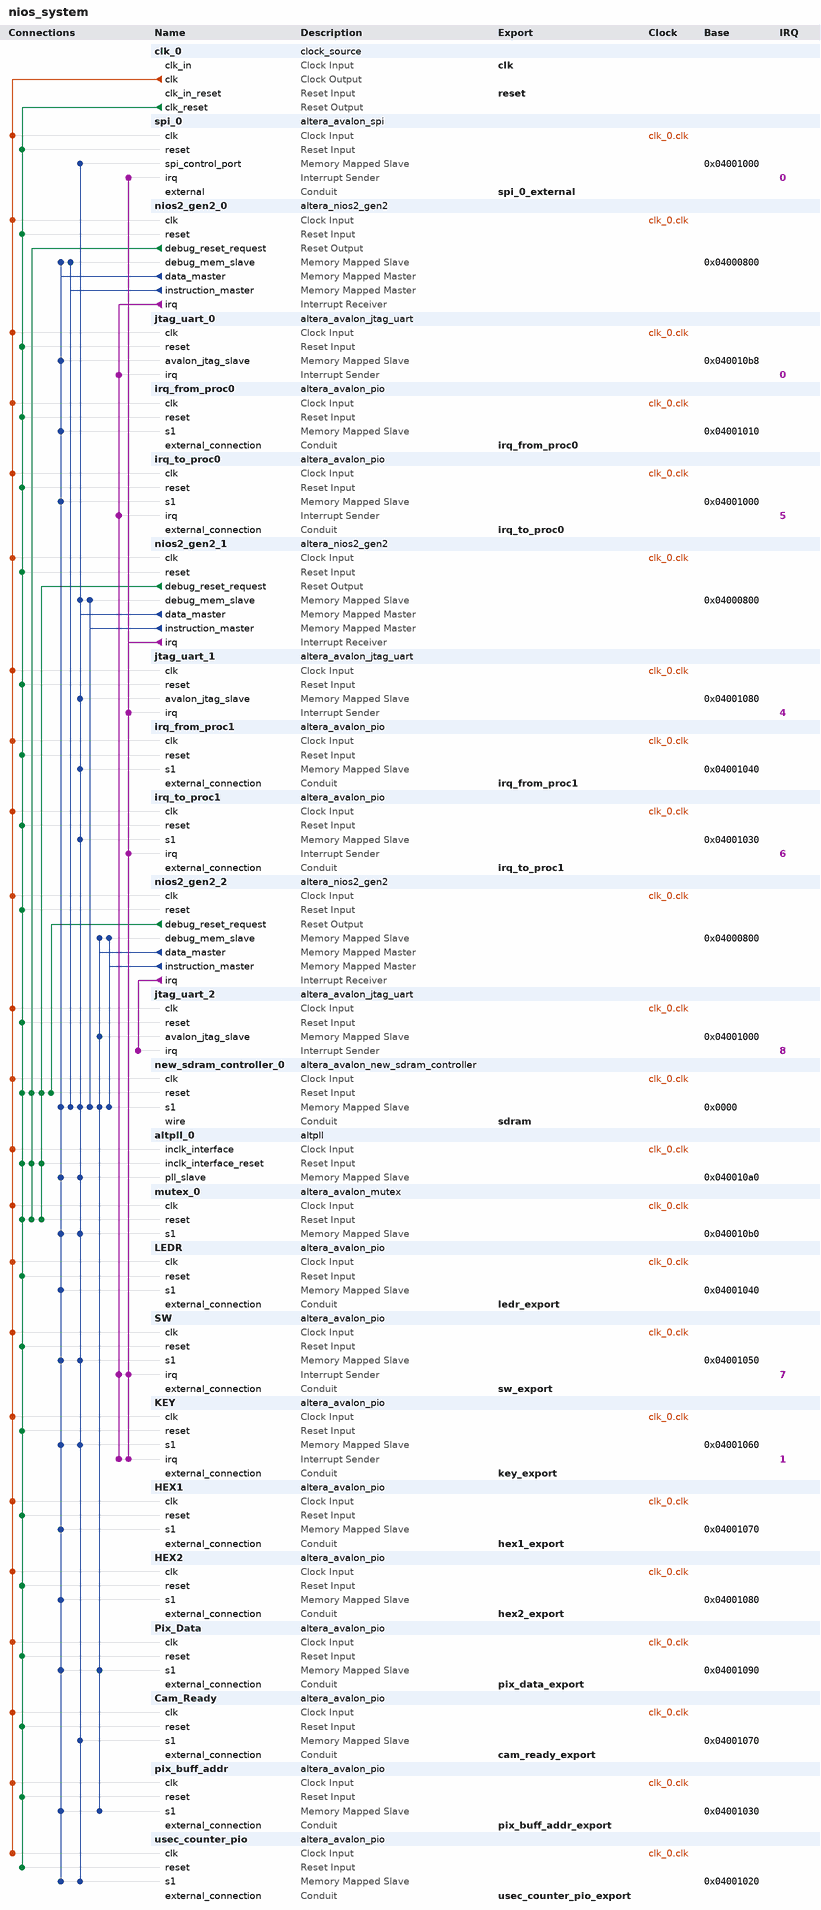
[diagram p0: system contents]
# Platform Designer (Qsys) system nios_system, MAX 10 10M50DAF484C7G
# Parameters at their usual value, and those the tool derives, are not listed.
package require -exact qsys 18.1
create_system nios_system
set_project_property DEVICE_FAMILY {MAX 10}
set_project_property DEVICE 10M50DAF484C7G

add_instance clk_0 clock_source 18.1
set_instance_parameter_value clk_0 clockFrequency 50000000

add_instance spi_0 altera_avalon_spi 18.1
set_instance_parameter_value spi_0 clockPhase 1
set_instance_parameter_value spi_0 clockPolarity 1
set_instance_parameter_value spi_0 dataWidth 8
set_instance_parameter_value spi_0 masterSPI true
set_instance_parameter_value spi_0 numberOfSlaves 2
set_instance_parameter_value spi_0 targetClockRate 5000000

add_instance nios2_gen2_0 altera_nios2_gen2 18.1
set_instance_parameter_value nios2_gen2_0 dcache_size 2048
set_instance_parameter_value nios2_gen2_0 exceptionSlave new_sdram_controller_0.s1
set_instance_parameter_value nios2_gen2_0 icache_size 4096
set_instance_parameter_value nios2_gen2_0 impl Fast
set_instance_parameter_value nios2_gen2_0 resetSlave new_sdram_controller_0.s1

add_instance jtag_uart_0 altera_avalon_jtag_uart 18.1
set_instance_parameter_value jtag_uart_0 simInteractiveOptions NO_INTERACTIVE_WINDOWS

add_instance irq_from_proc0 altera_avalon_pio 18.1
set_instance_parameter_value irq_from_proc0 direction Output
set_instance_parameter_value irq_from_proc0 width 1

add_instance irq_to_proc0 altera_avalon_pio 18.1
set_instance_parameter_value irq_to_proc0 direction Input
set_instance_parameter_value irq_to_proc0 generateIRQ true
set_instance_parameter_value irq_to_proc0 width 1

add_instance nios2_gen2_1 altera_nios2_gen2 18.1
set_instance_parameter_value nios2_gen2_1 cpuID 1
set_instance_parameter_value nios2_gen2_1 dcache_size 2048
set_instance_parameter_value nios2_gen2_1 exceptionOffset 33554464
set_instance_parameter_value nios2_gen2_1 exceptionSlave new_sdram_controller_0.s1
set_instance_parameter_value nios2_gen2_1 icache_size 4096
set_instance_parameter_value nios2_gen2_1 impl Fast
set_instance_parameter_value nios2_gen2_1 resetOffset 33554432
set_instance_parameter_value nios2_gen2_1 resetSlave new_sdram_controller_0.s1

add_instance jtag_uart_1 altera_avalon_jtag_uart 18.1
set_instance_parameter_value jtag_uart_1 simInteractiveOptions NO_INTERACTIVE_WINDOWS

add_instance irq_from_proc1 altera_avalon_pio 18.1
set_instance_parameter_value irq_from_proc1 direction Output
set_instance_parameter_value irq_from_proc1 width 1

add_instance irq_to_proc1 altera_avalon_pio 18.1
set_instance_parameter_value irq_to_proc1 direction Input
set_instance_parameter_value irq_to_proc1 generateIRQ true
set_instance_parameter_value irq_to_proc1 width 1

add_instance nios2_gen2_2 altera_nios2_gen2 18.1
set_instance_parameter_value nios2_gen2_2 cpuID 2
set_instance_parameter_value nios2_gen2_2 dcache_size 2048
set_instance_parameter_value nios2_gen2_2 exceptionOffset 8000064
set_instance_parameter_value nios2_gen2_2 exceptionSlave new_sdram_controller_0.s1
set_instance_parameter_value nios2_gen2_2 icache_size 4096
set_instance_parameter_value nios2_gen2_2 impl Fast
set_instance_parameter_value nios2_gen2_2 resetOffset 8000032
set_instance_parameter_value nios2_gen2_2 resetSlave new_sdram_controller_0.s1

add_instance jtag_uart_2 altera_avalon_jtag_uart 18.1
set_instance_parameter_value jtag_uart_2 simInteractiveOptions NO_INTERACTIVE_WINDOWS

add_instance new_sdram_controller_0 altera_avalon_new_sdram_controller 18.1
set_instance_parameter_value new_sdram_controller_0 TAC 5.5
set_instance_parameter_value new_sdram_controller_0 TRCD 20.0
set_instance_parameter_value new_sdram_controller_0 TRP 20.0
set_instance_parameter_value new_sdram_controller_0 casLatency 3
set_instance_parameter_value new_sdram_controller_0 columnWidth 10
set_instance_parameter_value new_sdram_controller_0 dataWidth 16
set_instance_parameter_value new_sdram_controller_0 generateSimulationModel false
set_instance_parameter_value new_sdram_controller_0 model single_Micron_MT48LC4M32B2_7_chip
set_instance_parameter_value new_sdram_controller_0 numberOfBanks 4
set_instance_parameter_value new_sdram_controller_0 numberOfChipSelects 1
set_instance_parameter_value new_sdram_controller_0 powerUpDelay 100.0
set_instance_parameter_value new_sdram_controller_0 refreshPeriod 15.625
set_instance_parameter_value new_sdram_controller_0 rowWidth 13

add_instance altpll_0 altpll 18.1
set_instance_parameter_value altpll_0 CLK0_DIVIDE_BY 1
set_instance_parameter_value altpll_0 CLK0_MULTIPLY_BY 1
set_instance_parameter_value altpll_0 CLK0_PHASE_SHIFT -3000
set_instance_parameter_value altpll_0 INCLK0_INPUT_FREQUENCY 20000
set_instance_parameter_value altpll_0 PORT_ARESET PORT_UNUSED
set_instance_parameter_value altpll_0 PORT_LOCKED PORT_UNUSED
set_instance_parameter_value altpll_0 PORT_clk1 PORT_UNUSED
set_instance_parameter_value altpll_0 PORT_clk2 PORT_UNUSED
set_instance_parameter_value altpll_0 PORT_clk3 PORT_UNUSED

add_instance mutex_0 altera_avalon_mutex 18.1

add_instance LEDR altera_avalon_pio 18.1
set_instance_parameter_value LEDR direction Output
set_instance_parameter_value LEDR width 10

add_instance SW altera_avalon_pio 18.1
set_instance_parameter_value SW captureEdge true
set_instance_parameter_value SW direction Input
set_instance_parameter_value SW generateIRQ true
set_instance_parameter_value SW irqType EDGE
set_instance_parameter_value SW width 10

add_instance KEY altera_avalon_pio 18.1
set_instance_parameter_value KEY captureEdge true
set_instance_parameter_value KEY direction Input
set_instance_parameter_value KEY generateIRQ true
set_instance_parameter_value KEY irqType EDGE
set_instance_parameter_value KEY width 2

add_instance HEX1 altera_avalon_pio 18.1
set_instance_parameter_value HEX1 direction Output
set_instance_parameter_value HEX1 width 24

add_instance HEX2 altera_avalon_pio 18.1
set_instance_parameter_value HEX2 direction Output
set_instance_parameter_value HEX2 width 24

add_instance Pix_Data altera_avalon_pio 18.1
set_instance_parameter_value Pix_Data direction Output
set_instance_parameter_value Pix_Data width 4

add_instance Cam_Ready altera_avalon_pio 18.1
set_instance_parameter_value Cam_Ready direction Input
set_instance_parameter_value Cam_Ready width 1

add_instance pix_buff_addr altera_avalon_pio 18.1
set_instance_parameter_value pix_buff_addr direction Output
set_instance_parameter_value pix_buff_addr width 17

add_instance usec_counter_pio altera_avalon_pio 18.1
set_instance_parameter_value usec_counter_pio direction Input
set_instance_parameter_value usec_counter_pio width 32

# connections
add_connection clk_0.clk altpll_0.inclk_interface clock
add_connection clk_0.clk Cam_Ready.clk clock
add_connection clk_0.clk HEX1.clk clock
add_connection clk_0.clk HEX2.clk clock
add_connection clk_0.clk irq_from_proc0.clk clock
add_connection clk_0.clk irq_from_proc1.clk clock
add_connection clk_0.clk irq_to_proc0.clk clock
add_connection clk_0.clk irq_to_proc1.clk clock
add_connection clk_0.clk jtag_uart_0.clk clock
add_connection clk_0.clk jtag_uart_1.clk clock
add_connection clk_0.clk jtag_uart_2.clk clock
add_connection clk_0.clk KEY.clk clock
add_connection clk_0.clk LEDR.clk clock
add_connection clk_0.clk mutex_0.clk clock
add_connection clk_0.clk new_sdram_controller_0.clk clock
add_connection clk_0.clk nios2_gen2_0.clk clock
add_connection clk_0.clk nios2_gen2_1.clk clock
add_connection clk_0.clk nios2_gen2_2.clk clock
add_connection clk_0.clk pix_buff_addr.clk clock
add_connection clk_0.clk Pix_Data.clk clock
add_connection clk_0.clk spi_0.clk clock
add_connection clk_0.clk SW.clk clock
add_connection clk_0.clk usec_counter_pio.clk clock
add_connection clk_0.clk_reset altpll_0.inclk_interface_reset reset
add_connection clk_0.clk_reset Cam_Ready.reset reset
add_connection clk_0.clk_reset HEX1.reset reset
add_connection clk_0.clk_reset HEX2.reset reset
add_connection clk_0.clk_reset irq_from_proc0.reset reset
add_connection clk_0.clk_reset irq_from_proc1.reset reset
add_connection clk_0.clk_reset irq_to_proc0.reset reset
add_connection clk_0.clk_reset irq_to_proc1.reset reset
add_connection clk_0.clk_reset jtag_uart_0.reset reset
add_connection clk_0.clk_reset jtag_uart_1.reset reset
add_connection clk_0.clk_reset jtag_uart_2.reset reset
add_connection clk_0.clk_reset KEY.reset reset
add_connection clk_0.clk_reset LEDR.reset reset
add_connection clk_0.clk_reset mutex_0.reset reset
add_connection clk_0.clk_reset new_sdram_controller_0.reset reset
add_connection clk_0.clk_reset nios2_gen2_0.reset reset
add_connection clk_0.clk_reset nios2_gen2_1.reset reset
add_connection clk_0.clk_reset nios2_gen2_2.reset reset
add_connection clk_0.clk_reset pix_buff_addr.reset reset
add_connection clk_0.clk_reset Pix_Data.reset reset
add_connection clk_0.clk_reset spi_0.reset reset
add_connection clk_0.clk_reset SW.reset reset
add_connection clk_0.clk_reset usec_counter_pio.reset reset
add_connection nios2_gen2_0.debug_reset_request altpll_0.inclk_interface_reset reset
add_connection nios2_gen2_0.debug_reset_request mutex_0.reset reset
add_connection nios2_gen2_0.debug_reset_request new_sdram_controller_0.reset reset
add_connection nios2_gen2_1.debug_reset_request altpll_0.inclk_interface_reset reset
add_connection nios2_gen2_1.debug_reset_request mutex_0.reset reset
add_connection nios2_gen2_1.debug_reset_request new_sdram_controller_0.reset reset
add_connection nios2_gen2_2.debug_reset_request new_sdram_controller_0.reset reset
add_connection nios2_gen2_0.data_master altpll_0.pll_slave avalon
set_connection_parameter_value nios2_gen2_0.data_master/altpll_0.pll_slave baseAddress 0x040010a0
add_connection nios2_gen2_0.data_master HEX1.s1 avalon
set_connection_parameter_value nios2_gen2_0.data_master/HEX1.s1 baseAddress 0x04001070
add_connection nios2_gen2_0.data_master HEX2.s1 avalon
set_connection_parameter_value nios2_gen2_0.data_master/HEX2.s1 baseAddress 0x04001080
add_connection nios2_gen2_0.data_master irq_from_proc0.s1 avalon
set_connection_parameter_value nios2_gen2_0.data_master/irq_from_proc0.s1 baseAddress 0x04001010
add_connection nios2_gen2_0.data_master irq_to_proc0.s1 avalon
set_connection_parameter_value nios2_gen2_0.data_master/irq_to_proc0.s1 baseAddress 0x04001000
add_connection nios2_gen2_0.data_master jtag_uart_0.avalon_jtag_slave avalon
set_connection_parameter_value nios2_gen2_0.data_master/jtag_uart_0.avalon_jtag_slave baseAddress 0x040010b8
add_connection nios2_gen2_0.data_master KEY.s1 avalon
set_connection_parameter_value nios2_gen2_0.data_master/KEY.s1 baseAddress 0x04001060
add_connection nios2_gen2_0.data_master LEDR.s1 avalon
set_connection_parameter_value nios2_gen2_0.data_master/LEDR.s1 baseAddress 0x04001040
add_connection nios2_gen2_0.data_master mutex_0.s1 avalon
set_connection_parameter_value nios2_gen2_0.data_master/mutex_0.s1 baseAddress 0x040010b0
add_connection nios2_gen2_0.data_master new_sdram_controller_0.s1 avalon
set_connection_parameter_value nios2_gen2_0.data_master/new_sdram_controller_0.s1 baseAddress 0x0000
add_connection nios2_gen2_0.data_master nios2_gen2_0.debug_mem_slave avalon
set_connection_parameter_value nios2_gen2_0.data_master/nios2_gen2_0.debug_mem_slave baseAddress 0x04000800
add_connection nios2_gen2_0.data_master pix_buff_addr.s1 avalon
set_connection_parameter_value nios2_gen2_0.data_master/pix_buff_addr.s1 baseAddress 0x04001030
add_connection nios2_gen2_0.data_master Pix_Data.s1 avalon
set_connection_parameter_value nios2_gen2_0.data_master/Pix_Data.s1 baseAddress 0x04001090
add_connection nios2_gen2_0.data_master SW.s1 avalon
set_connection_parameter_value nios2_gen2_0.data_master/SW.s1 baseAddress 0x04001050
add_connection nios2_gen2_0.data_master usec_counter_pio.s1 avalon
set_connection_parameter_value nios2_gen2_0.data_master/usec_counter_pio.s1 baseAddress 0x04001020
add_connection nios2_gen2_0.instruction_master new_sdram_controller_0.s1 avalon
set_connection_parameter_value nios2_gen2_0.instruction_master/new_sdram_controller_0.s1 baseAddress 0x0000
add_connection nios2_gen2_0.instruction_master nios2_gen2_0.debug_mem_slave avalon
set_connection_parameter_value nios2_gen2_0.instruction_master/nios2_gen2_0.debug_mem_slave baseAddress 0x04000800
add_connection nios2_gen2_1.data_master altpll_0.pll_slave avalon
set_connection_parameter_value nios2_gen2_1.data_master/altpll_0.pll_slave baseAddress 0x040010a0
add_connection nios2_gen2_1.data_master Cam_Ready.s1 avalon
set_connection_parameter_value nios2_gen2_1.data_master/Cam_Ready.s1 baseAddress 0x04001070
add_connection nios2_gen2_1.data_master irq_from_proc1.s1 avalon
set_connection_parameter_value nios2_gen2_1.data_master/irq_from_proc1.s1 baseAddress 0x04001040
add_connection nios2_gen2_1.data_master irq_to_proc1.s1 avalon
set_connection_parameter_value nios2_gen2_1.data_master/irq_to_proc1.s1 baseAddress 0x04001030
add_connection nios2_gen2_1.data_master jtag_uart_1.avalon_jtag_slave avalon
set_connection_parameter_value nios2_gen2_1.data_master/jtag_uart_1.avalon_jtag_slave baseAddress 0x04001080
add_connection nios2_gen2_1.data_master KEY.s1 avalon
set_connection_parameter_value nios2_gen2_1.data_master/KEY.s1 baseAddress 0x04001060
add_connection nios2_gen2_1.data_master mutex_0.s1 avalon
set_connection_parameter_value nios2_gen2_1.data_master/mutex_0.s1 baseAddress 0x040010b0
add_connection nios2_gen2_1.data_master new_sdram_controller_0.s1 avalon
set_connection_parameter_value nios2_gen2_1.data_master/new_sdram_controller_0.s1 baseAddress 0x0000
add_connection nios2_gen2_1.data_master nios2_gen2_1.debug_mem_slave avalon
set_connection_parameter_value nios2_gen2_1.data_master/nios2_gen2_1.debug_mem_slave baseAddress 0x04000800
add_connection nios2_gen2_1.data_master spi_0.spi_control_port avalon
set_connection_parameter_value nios2_gen2_1.data_master/spi_0.spi_control_port baseAddress 0x04001000
add_connection nios2_gen2_1.data_master SW.s1 avalon
set_connection_parameter_value nios2_gen2_1.data_master/SW.s1 baseAddress 0x04001050
add_connection nios2_gen2_1.data_master usec_counter_pio.s1 avalon
set_connection_parameter_value nios2_gen2_1.data_master/usec_counter_pio.s1 baseAddress 0x04001020
add_connection nios2_gen2_1.instruction_master new_sdram_controller_0.s1 avalon
set_connection_parameter_value nios2_gen2_1.instruction_master/new_sdram_controller_0.s1 baseAddress 0x0000
add_connection nios2_gen2_1.instruction_master nios2_gen2_1.debug_mem_slave avalon
set_connection_parameter_value nios2_gen2_1.instruction_master/nios2_gen2_1.debug_mem_slave baseAddress 0x04000800
add_connection nios2_gen2_2.data_master jtag_uart_2.avalon_jtag_slave avalon
set_connection_parameter_value nios2_gen2_2.data_master/jtag_uart_2.avalon_jtag_slave baseAddress 0x04001000
add_connection nios2_gen2_2.data_master new_sdram_controller_0.s1 avalon
set_connection_parameter_value nios2_gen2_2.data_master/new_sdram_controller_0.s1 baseAddress 0x0000
add_connection nios2_gen2_2.data_master nios2_gen2_2.debug_mem_slave avalon
set_connection_parameter_value nios2_gen2_2.data_master/nios2_gen2_2.debug_mem_slave baseAddress 0x04000800
add_connection nios2_gen2_2.data_master pix_buff_addr.s1 avalon
set_connection_parameter_value nios2_gen2_2.data_master/pix_buff_addr.s1 baseAddress 0x04001030
add_connection nios2_gen2_2.data_master Pix_Data.s1 avalon
set_connection_parameter_value nios2_gen2_2.data_master/Pix_Data.s1 baseAddress 0x04001090
add_connection nios2_gen2_2.instruction_master new_sdram_controller_0.s1 avalon
set_connection_parameter_value nios2_gen2_2.instruction_master/new_sdram_controller_0.s1 baseAddress 0x0000
add_connection nios2_gen2_2.instruction_master nios2_gen2_2.debug_mem_slave avalon
set_connection_parameter_value nios2_gen2_2.instruction_master/nios2_gen2_2.debug_mem_slave baseAddress 0x04000800
add_connection nios2_gen2_0.irq irq_to_proc0.irq interrupt
set_connection_parameter_value nios2_gen2_0.irq/irq_to_proc0.irq irqNumber 5
add_connection nios2_gen2_0.irq jtag_uart_0.irq interrupt
set_connection_parameter_value nios2_gen2_0.irq/jtag_uart_0.irq irqNumber 0
add_connection nios2_gen2_0.irq KEY.irq interrupt
set_connection_parameter_value nios2_gen2_0.irq/KEY.irq irqNumber 3
add_connection nios2_gen2_0.irq SW.irq interrupt
set_connection_parameter_value nios2_gen2_0.irq/SW.irq irqNumber 2
add_connection nios2_gen2_1.irq irq_to_proc1.irq interrupt
set_connection_parameter_value nios2_gen2_1.irq/irq_to_proc1.irq irqNumber 6
add_connection nios2_gen2_1.irq jtag_uart_1.irq interrupt
set_connection_parameter_value nios2_gen2_1.irq/jtag_uart_1.irq irqNumber 4
add_connection nios2_gen2_1.irq KEY.irq interrupt
set_connection_parameter_value nios2_gen2_1.irq/KEY.irq irqNumber 1
add_connection nios2_gen2_1.irq spi_0.irq interrupt
set_connection_parameter_value nios2_gen2_1.irq/spi_0.irq irqNumber 0
add_connection nios2_gen2_1.irq SW.irq interrupt
set_connection_parameter_value nios2_gen2_1.irq/SW.irq irqNumber 7
add_connection nios2_gen2_2.irq jtag_uart_2.irq interrupt
set_connection_parameter_value nios2_gen2_2.irq/jtag_uart_2.irq irqNumber 8

# exported interfaces
add_interface cam_ready_export conduit end
set_interface_property cam_ready_export EXPORT_OF Cam_Ready.external_connection
add_interface clk clock sink
set_interface_property clk EXPORT_OF clk_0.clk_in
add_interface hex1_export conduit end
set_interface_property hex1_export EXPORT_OF HEX1.external_connection
add_interface hex2_export conduit end
set_interface_property hex2_export EXPORT_OF HEX2.external_connection
add_interface irq_from_proc0 conduit end
set_interface_property irq_from_proc0 EXPORT_OF irq_from_proc0.external_connection
add_interface irq_from_proc1 conduit end
set_interface_property irq_from_proc1 EXPORT_OF irq_from_proc1.external_connection
add_interface irq_to_proc0 conduit end
set_interface_property irq_to_proc0 EXPORT_OF irq_to_proc0.external_connection
add_interface irq_to_proc1 conduit end
set_interface_property irq_to_proc1 EXPORT_OF irq_to_proc1.external_connection
add_interface key_export conduit end
set_interface_property key_export EXPORT_OF KEY.external_connection
add_interface ledr_export conduit end
set_interface_property ledr_export EXPORT_OF LEDR.external_connection
add_interface pix_buff_addr_export conduit end
set_interface_property pix_buff_addr_export EXPORT_OF pix_buff_addr.external_connection
add_interface pix_data_export conduit end
set_interface_property pix_data_export EXPORT_OF Pix_Data.external_connection
add_interface reset reset sink
set_interface_property reset EXPORT_OF clk_0.clk_in_reset
add_interface sdram conduit end
set_interface_property sdram EXPORT_OF new_sdram_controller_0.wire
add_interface spi_0_external conduit end
set_interface_property spi_0_external EXPORT_OF spi_0.external
add_interface sw_export conduit end
set_interface_property sw_export EXPORT_OF SW.external_connection
add_interface usec_counter_pio_export conduit end
set_interface_property usec_counter_pio_export EXPORT_OF usec_counter_pio.external_connection

set_interconnect_requirement {$system} qsys_mm.clockCrossingAdapter HANDSHAKE
set_interconnect_requirement {$system} qsys_mm.enableEccProtection FALSE
set_interconnect_requirement {$system} qsys_mm.insertDefaultSlave FALSE
set_interconnect_requirement {$system} qsys_mm.maxAdditionalLatency 1

save_system nios_system.qsys
